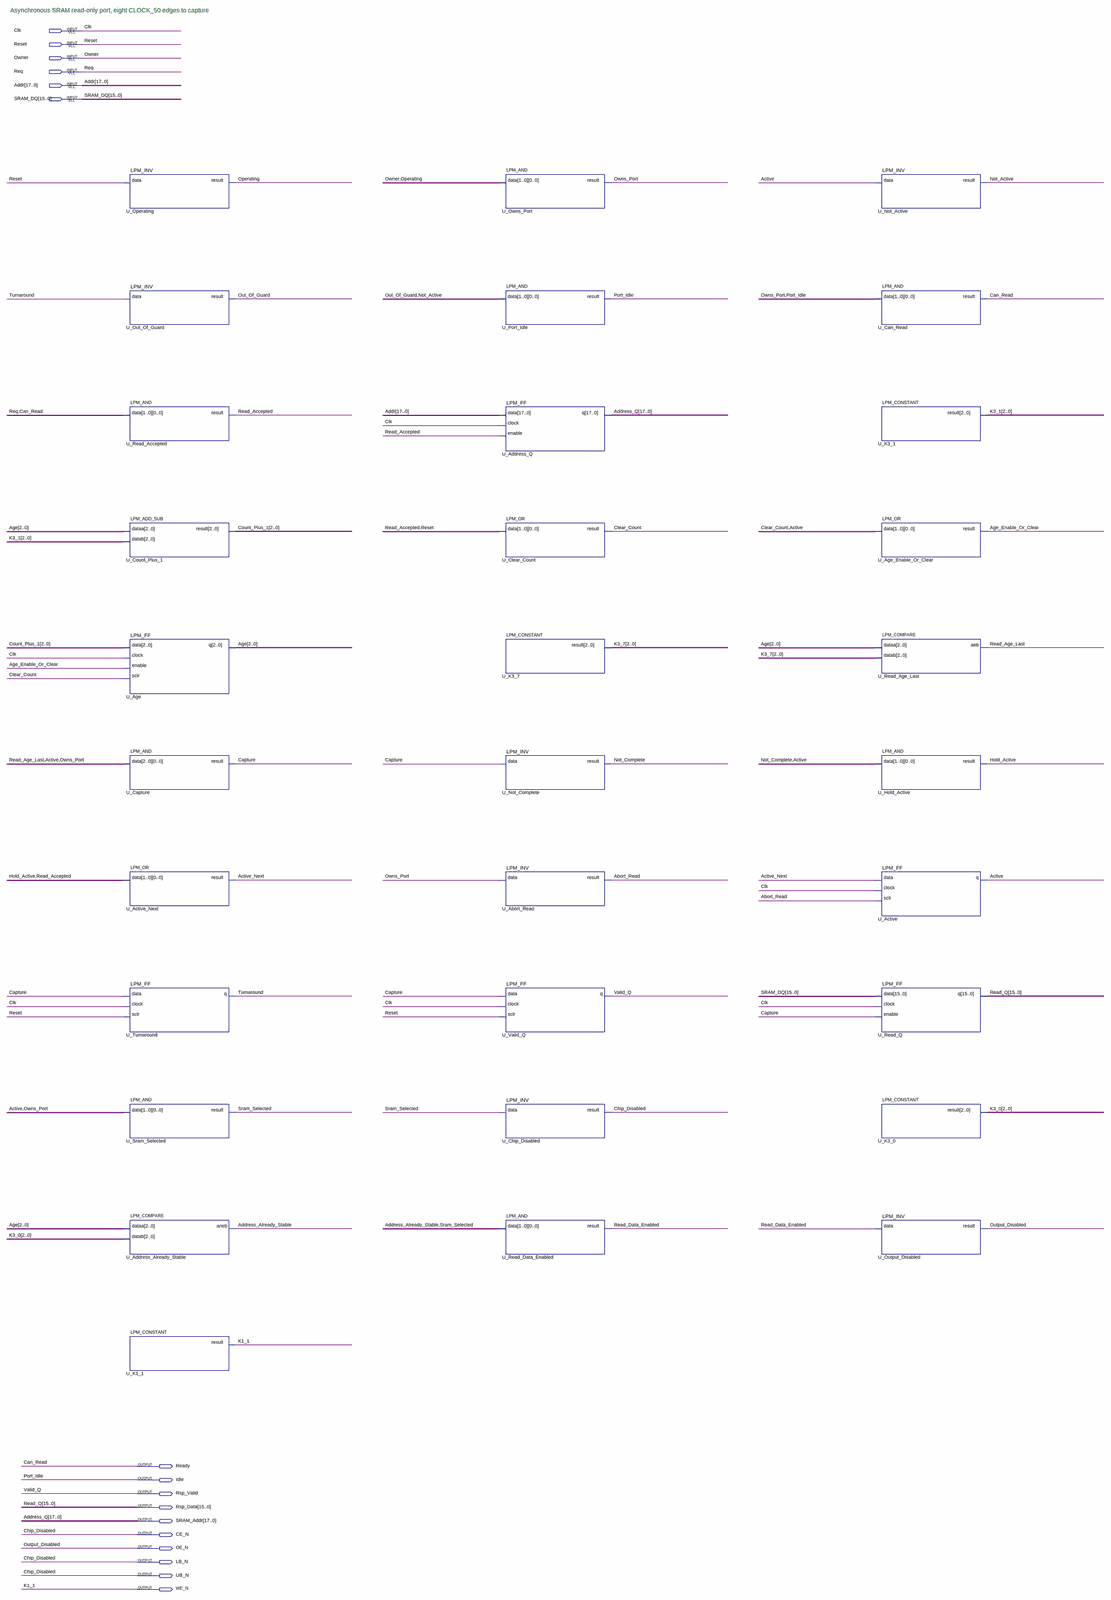
[diagram p0: schematic sheet, whole]
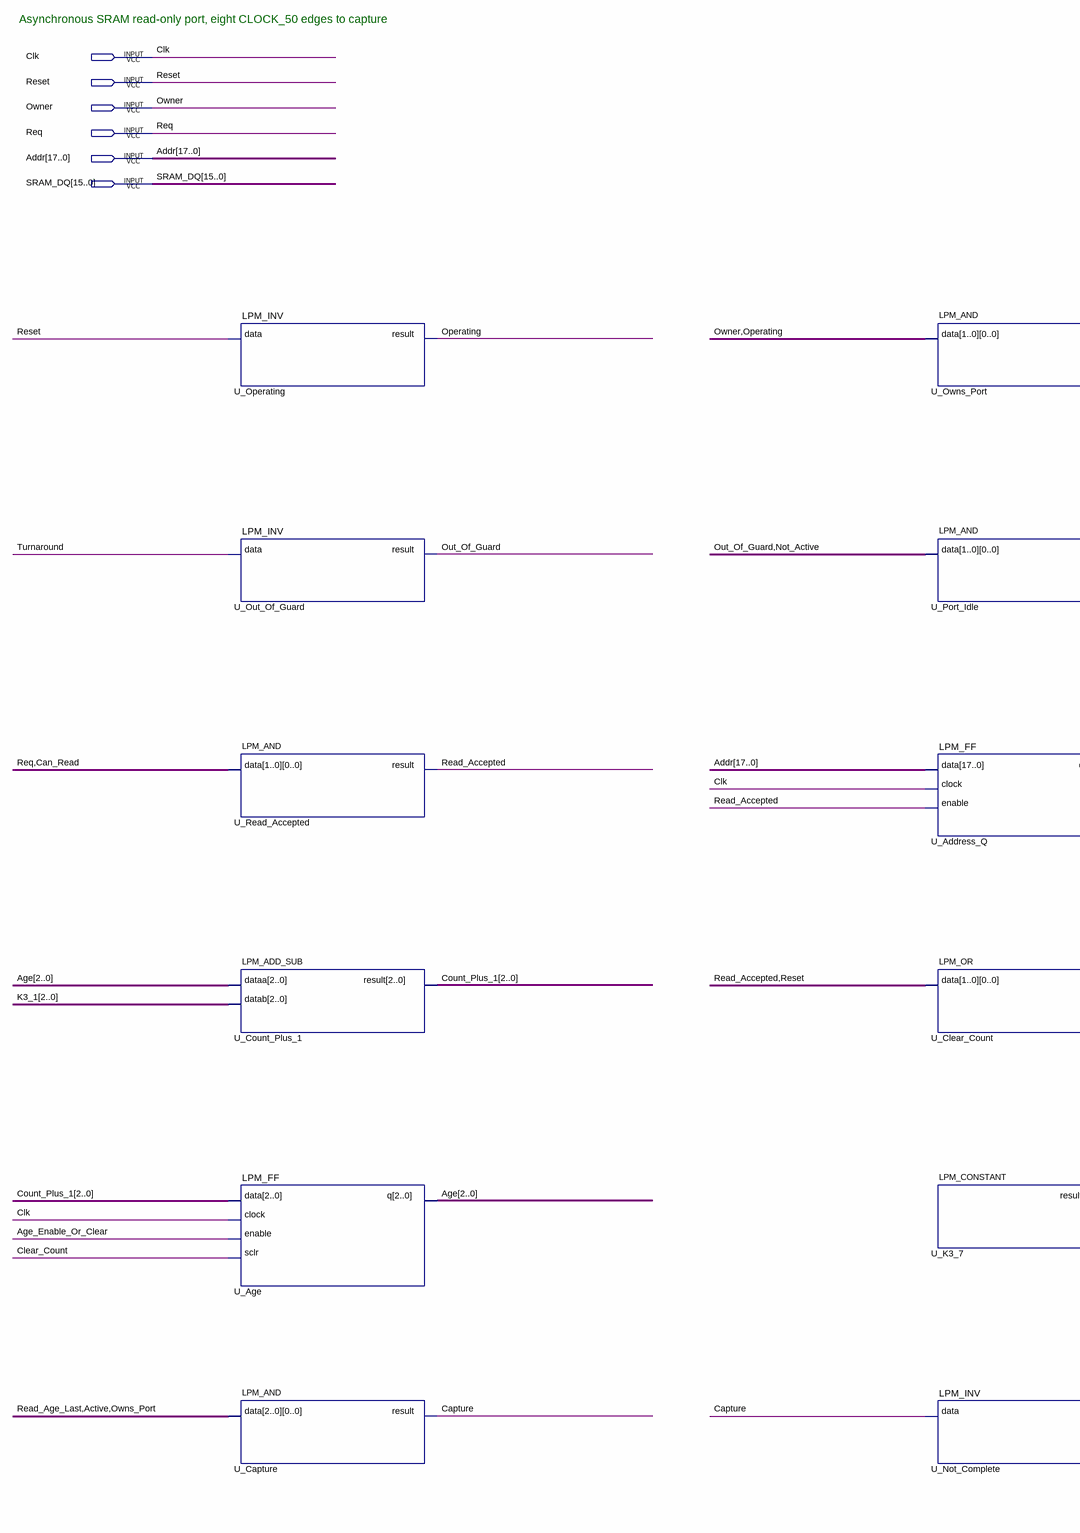
[diagram p1: schematic sheet, upper left part]
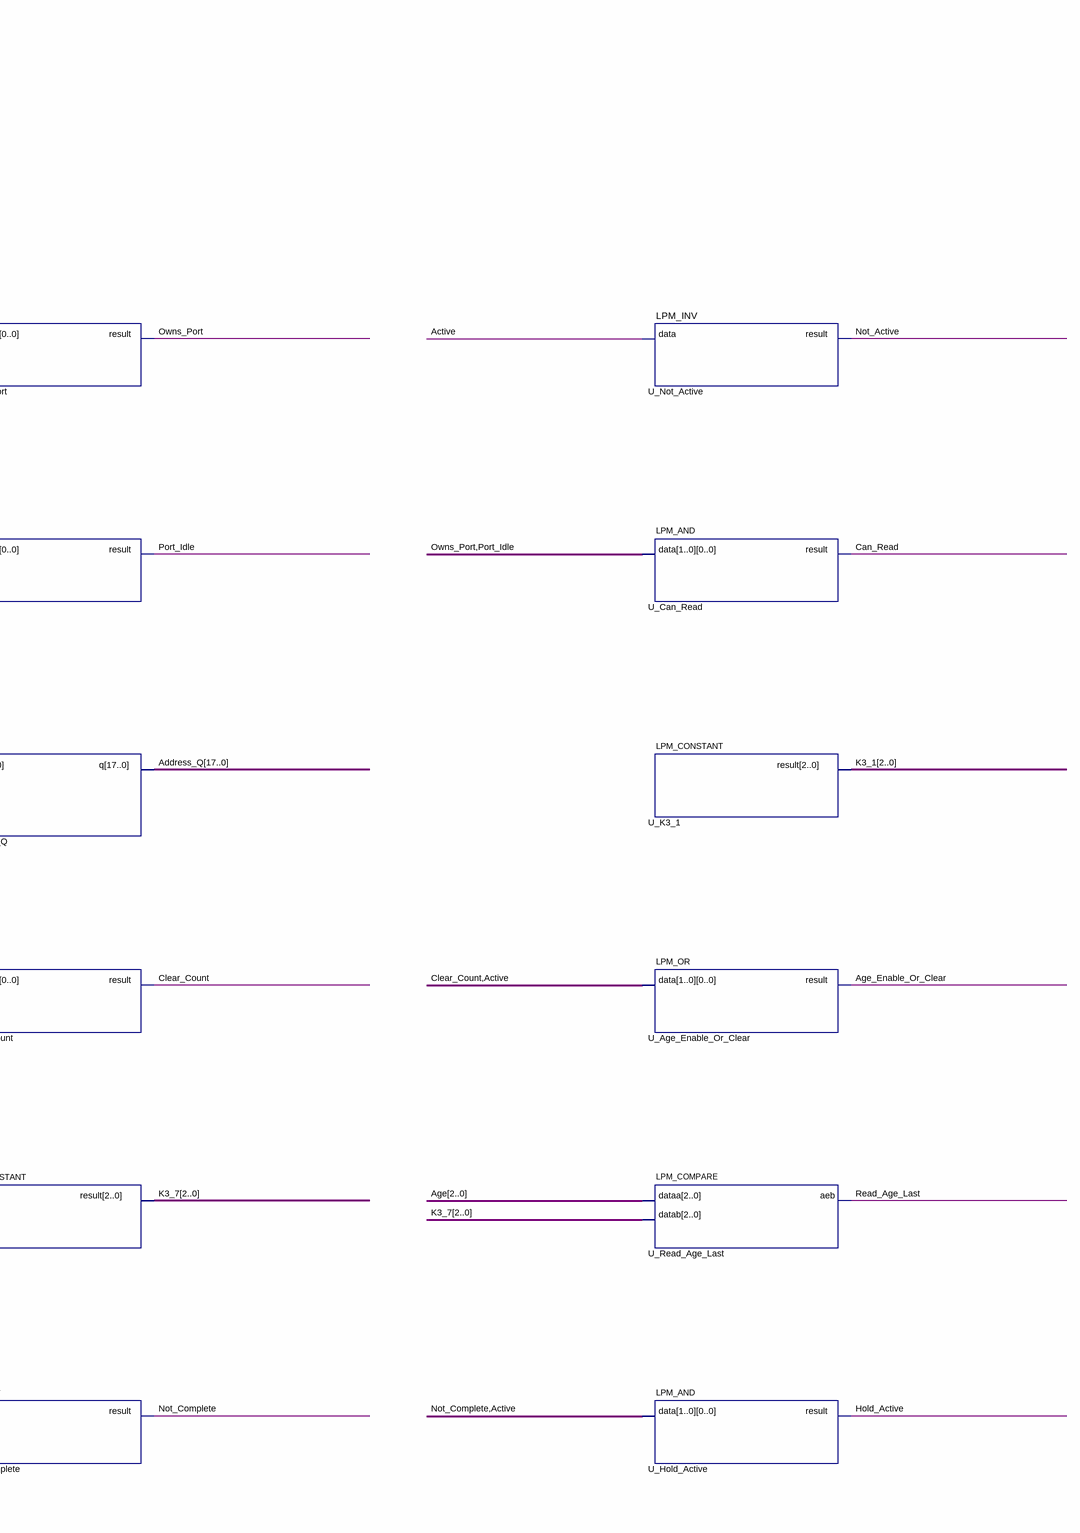
[diagram p2: schematic sheet, upper right part]
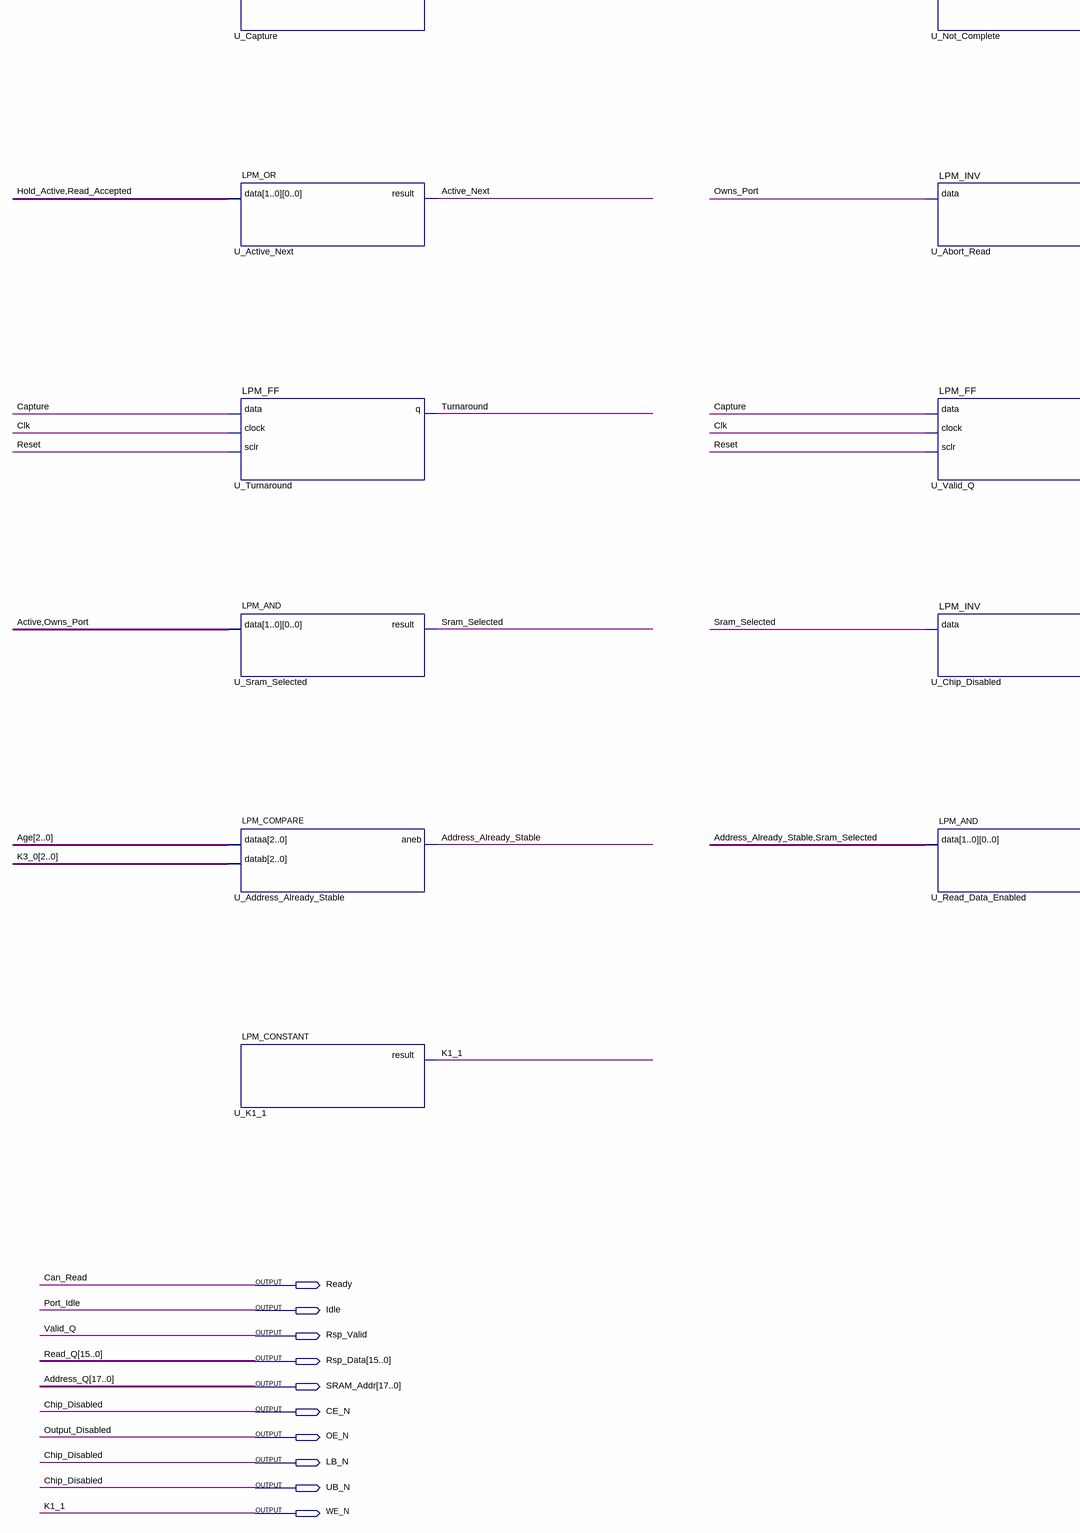
[diagram p3: schematic sheet, lower left part]
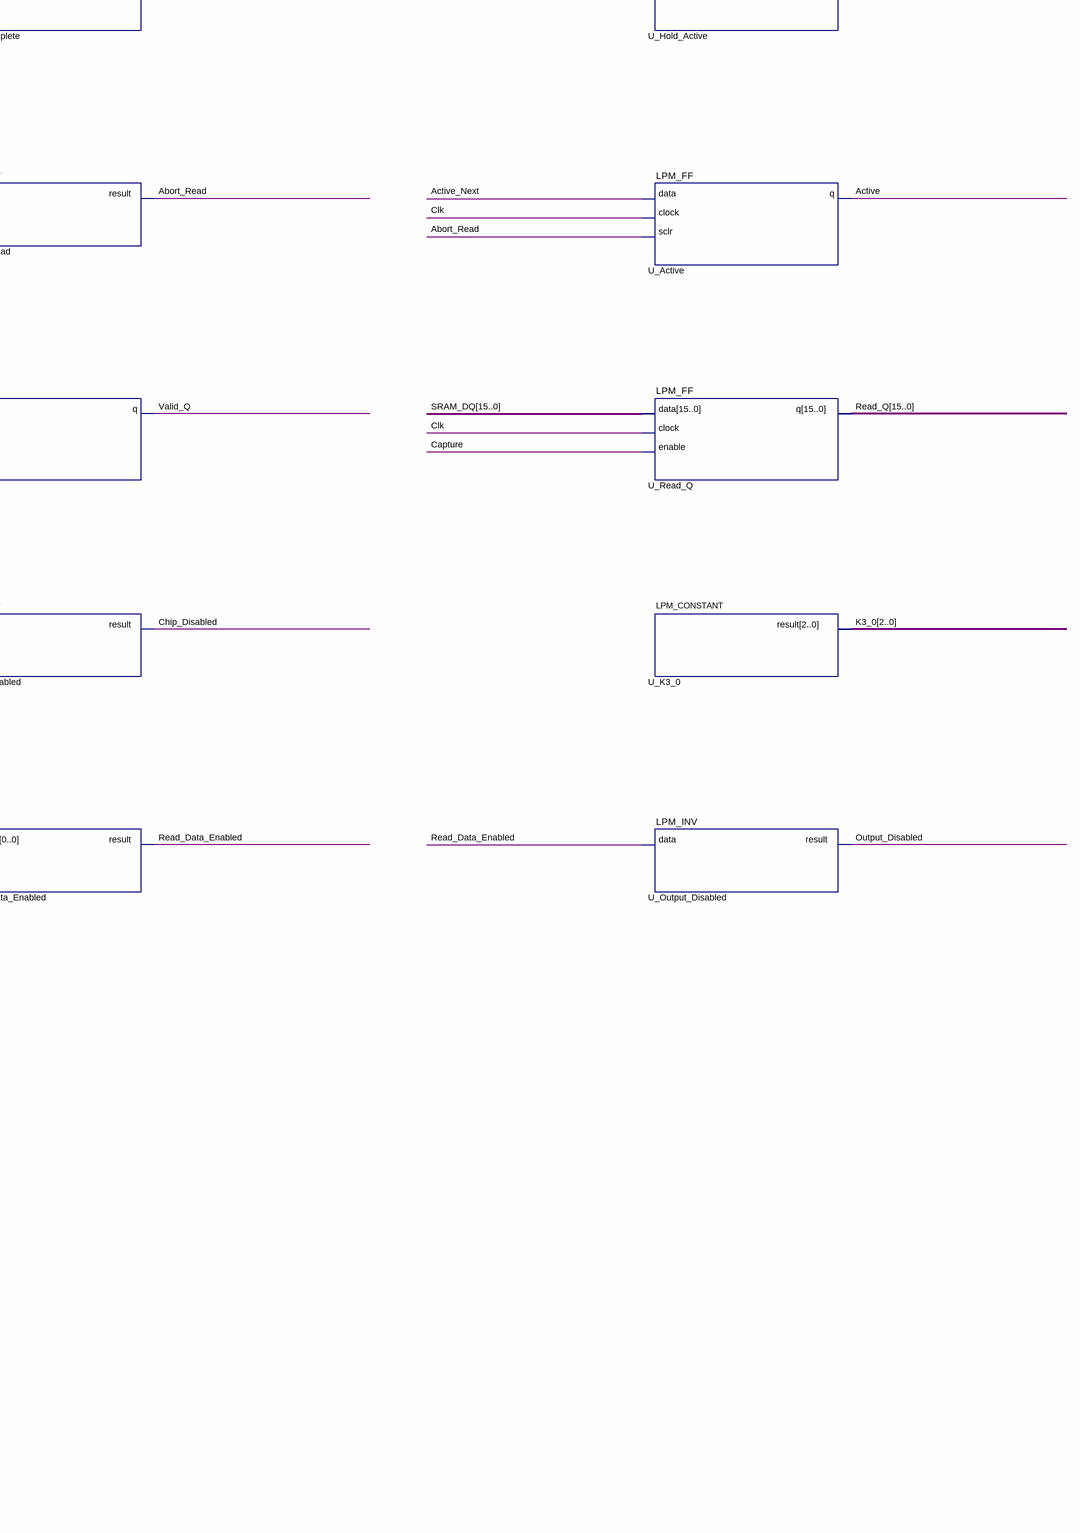
[diagram p4: schematic sheet, lower right part]
// Quartus schematic SRAM_Read_Port.bdf as structural Verilog: 31 symbols, 16 pins
module SRAM_Read_Port (
  input  Clk,
  input  Reset,
  input  Owner,
  input  Req,
  input  [17:0] Addr,
  input  [15:0] SRAM_DQ,
  output Ready,
  output Idle,
  output Rsp_Valid,
  output [15:0] Rsp_Data,
  output [17:0] SRAM_Addr,
  output CE_N,
  output OE_N,
  output LB_N,
  output UB_N,
  output WE_N
);

  wire Abort_Read, Active, Active_Next, Address_Already_Stable, Age_Enable_Or_Clear, Capture, Clear_Count,
       Hold_Active, Not_Active, Not_Complete, Operating, Out_Of_Guard, Owns_Port, Read_Accepted,
       Read_Age_Last, Read_Data_Enabled, Sram_Selected, Turnaround;
  wire [2:0] Age, Count_Plus_1, K3_0, K3_1, K3_7;

  LPM_INV #(.LPM_WIDTH(1)) U_Operating (.data(Reset), .result(Operating));
  LPM_INV #(.LPM_WIDTH(1)) U_Out_Of_Guard (.data(Turnaround), .result(Out_Of_Guard));
  LPM_AND #(.LPM_WIDTH(1), .LPM_SIZE(2)) U_Read_Accepted (.data({Req, Ready}), .result(Read_Accepted));
  LPM_ADD_SUB #(.LPM_WIDTH(3), .LPM_DIRECTION("ADD"), .LPM_REPRESENTATION("UNSIGNED")) U_Count_Plus_1 (
    .dataa(Age), .datab(K3_1), .result(Count_Plus_1));
  LPM_FF #(.LPM_WIDTH(3), .LPM_FFTYPE("DFF")) U_Age (
    .data(Count_Plus_1), .clock(Clk), .enable(Age_Enable_Or_Clear), .sclr(Clear_Count), .q(Age));
  LPM_AND #(.LPM_WIDTH(1), .LPM_SIZE(3)) U_Capture (.data({Read_Age_Last, Active, Owns_Port}), .result(Capture));
  LPM_OR #(.LPM_WIDTH(1), .LPM_SIZE(2)) U_Active_Next (.data({Hold_Active, Read_Accepted}), .result(Active_Next));
  LPM_FF #(.LPM_WIDTH(1), .LPM_FFTYPE("DFF")) U_Turnaround (.data(Capture), .clock(Clk), .sclr(Reset), .q(Turnaround));
  LPM_AND #(.LPM_WIDTH(1), .LPM_SIZE(2)) U_Sram_Selected (.data({Active, Owns_Port}), .result(Sram_Selected));
  LPM_COMPARE #(.LPM_WIDTH(3), .LPM_REPRESENTATION("UNSIGNED")) U_Address_Already_Stable (
    .dataa(Age), .datab(K3_0), .aneb(Address_Already_Stable));
  LPM_CONSTANT #(.LPM_WIDTH(1), .LPM_CVALUE(1)) U_K1_1 (.result(WE_N));
  LPM_AND #(.LPM_WIDTH(1), .LPM_SIZE(2)) U_Owns_Port (.data({Owner, Operating}), .result(Owns_Port));
  LPM_AND #(.LPM_WIDTH(1), .LPM_SIZE(2)) U_Port_Idle (.data({Out_Of_Guard, Not_Active}), .result(Idle));
  LPM_FF #(.LPM_WIDTH(18), .LPM_FFTYPE("DFF")) U_Address_Q (
    .data(Addr), .clock(Clk), .enable(Read_Accepted), .q(SRAM_Addr));
  LPM_OR #(.LPM_WIDTH(1), .LPM_SIZE(2)) U_Clear_Count (.data({Read_Accepted, Reset}), .result(Clear_Count));
  LPM_CONSTANT #(.LPM_WIDTH(3), .LPM_CVALUE(7)) U_K3_7 (.result(K3_7));
  LPM_INV #(.LPM_WIDTH(1)) U_Not_Complete (.data(Capture), .result(Not_Complete));
  LPM_INV #(.LPM_WIDTH(1)) U_Abort_Read (.data(Owns_Port), .result(Abort_Read));
  LPM_FF #(.LPM_WIDTH(1), .LPM_FFTYPE("DFF")) U_Valid_Q (.data(Capture), .clock(Clk), .sclr(Reset), .q(Rsp_Valid));
  LPM_INV #(.LPM_WIDTH(1)) U_Chip_Disabled (.data(Sram_Selected), .result(CE_N));
  LPM_AND #(.LPM_WIDTH(1), .LPM_SIZE(2)) U_Read_Data_Enabled (
    .data({Address_Already_Stable, Sram_Selected}), .result(Read_Data_Enabled));
  LPM_INV #(.LPM_WIDTH(1)) U_Not_Active (.data(Active), .result(Not_Active));
  LPM_AND #(.LPM_WIDTH(1), .LPM_SIZE(2)) U_Can_Read (.data({Owns_Port, Idle}), .result(Ready));
  LPM_CONSTANT #(.LPM_WIDTH(3), .LPM_CVALUE(1)) U_K3_1 (.result(K3_1));
  LPM_OR #(.LPM_WIDTH(1), .LPM_SIZE(2)) U_Age_Enable_Or_Clear (
    .data({Clear_Count, Active}), .result(Age_Enable_Or_Clear));
  LPM_COMPARE #(.LPM_WIDTH(3), .LPM_REPRESENTATION("UNSIGNED")) U_Read_Age_Last (
    .dataa(Age), .datab(K3_7), .aeb(Read_Age_Last));
  LPM_AND #(.LPM_WIDTH(1), .LPM_SIZE(2)) U_Hold_Active (.data({Not_Complete, Active}), .result(Hold_Active));
  LPM_FF #(.LPM_WIDTH(1), .LPM_FFTYPE("DFF")) U_Active (.data(Active_Next), .clock(Clk), .sclr(Abort_Read), .q(Active));
  LPM_FF #(.LPM_WIDTH(16), .LPM_FFTYPE("DFF")) U_Read_Q (.data(SRAM_DQ), .clock(Clk), .enable(Capture), .q(Rsp_Data));
  LPM_CONSTANT #(.LPM_WIDTH(3), .LPM_CVALUE(0)) U_K3_0 (.result(K3_0));
  LPM_INV #(.LPM_WIDTH(1)) U_Output_Disabled (.data(Read_Data_Enabled), .result(OE_N));

  assign LB_N = CE_N;
  assign UB_N = CE_N;

  // Other names for the same wires on the sheet: Address_Q[17:0] = SRAM_Addr; Can_Read = Ready; Chip_Disabled = CE_N;
  //   K1_1 = WE_N; Output_Disabled = OE_N; Port_Idle = Idle; Read_Q[15:0] = Rsp_Data; Valid_Q = Rsp_Valid

  // Notes on the sheet:
  //   Asynchronous SRAM read-only port, eight CLOCK_50 edges to capture
endmodule
